# Altium schematic sheet MCU.SchDoc
size A3; DocumentNumber: 1; SheetNumber: 16; SheetTotal: 17
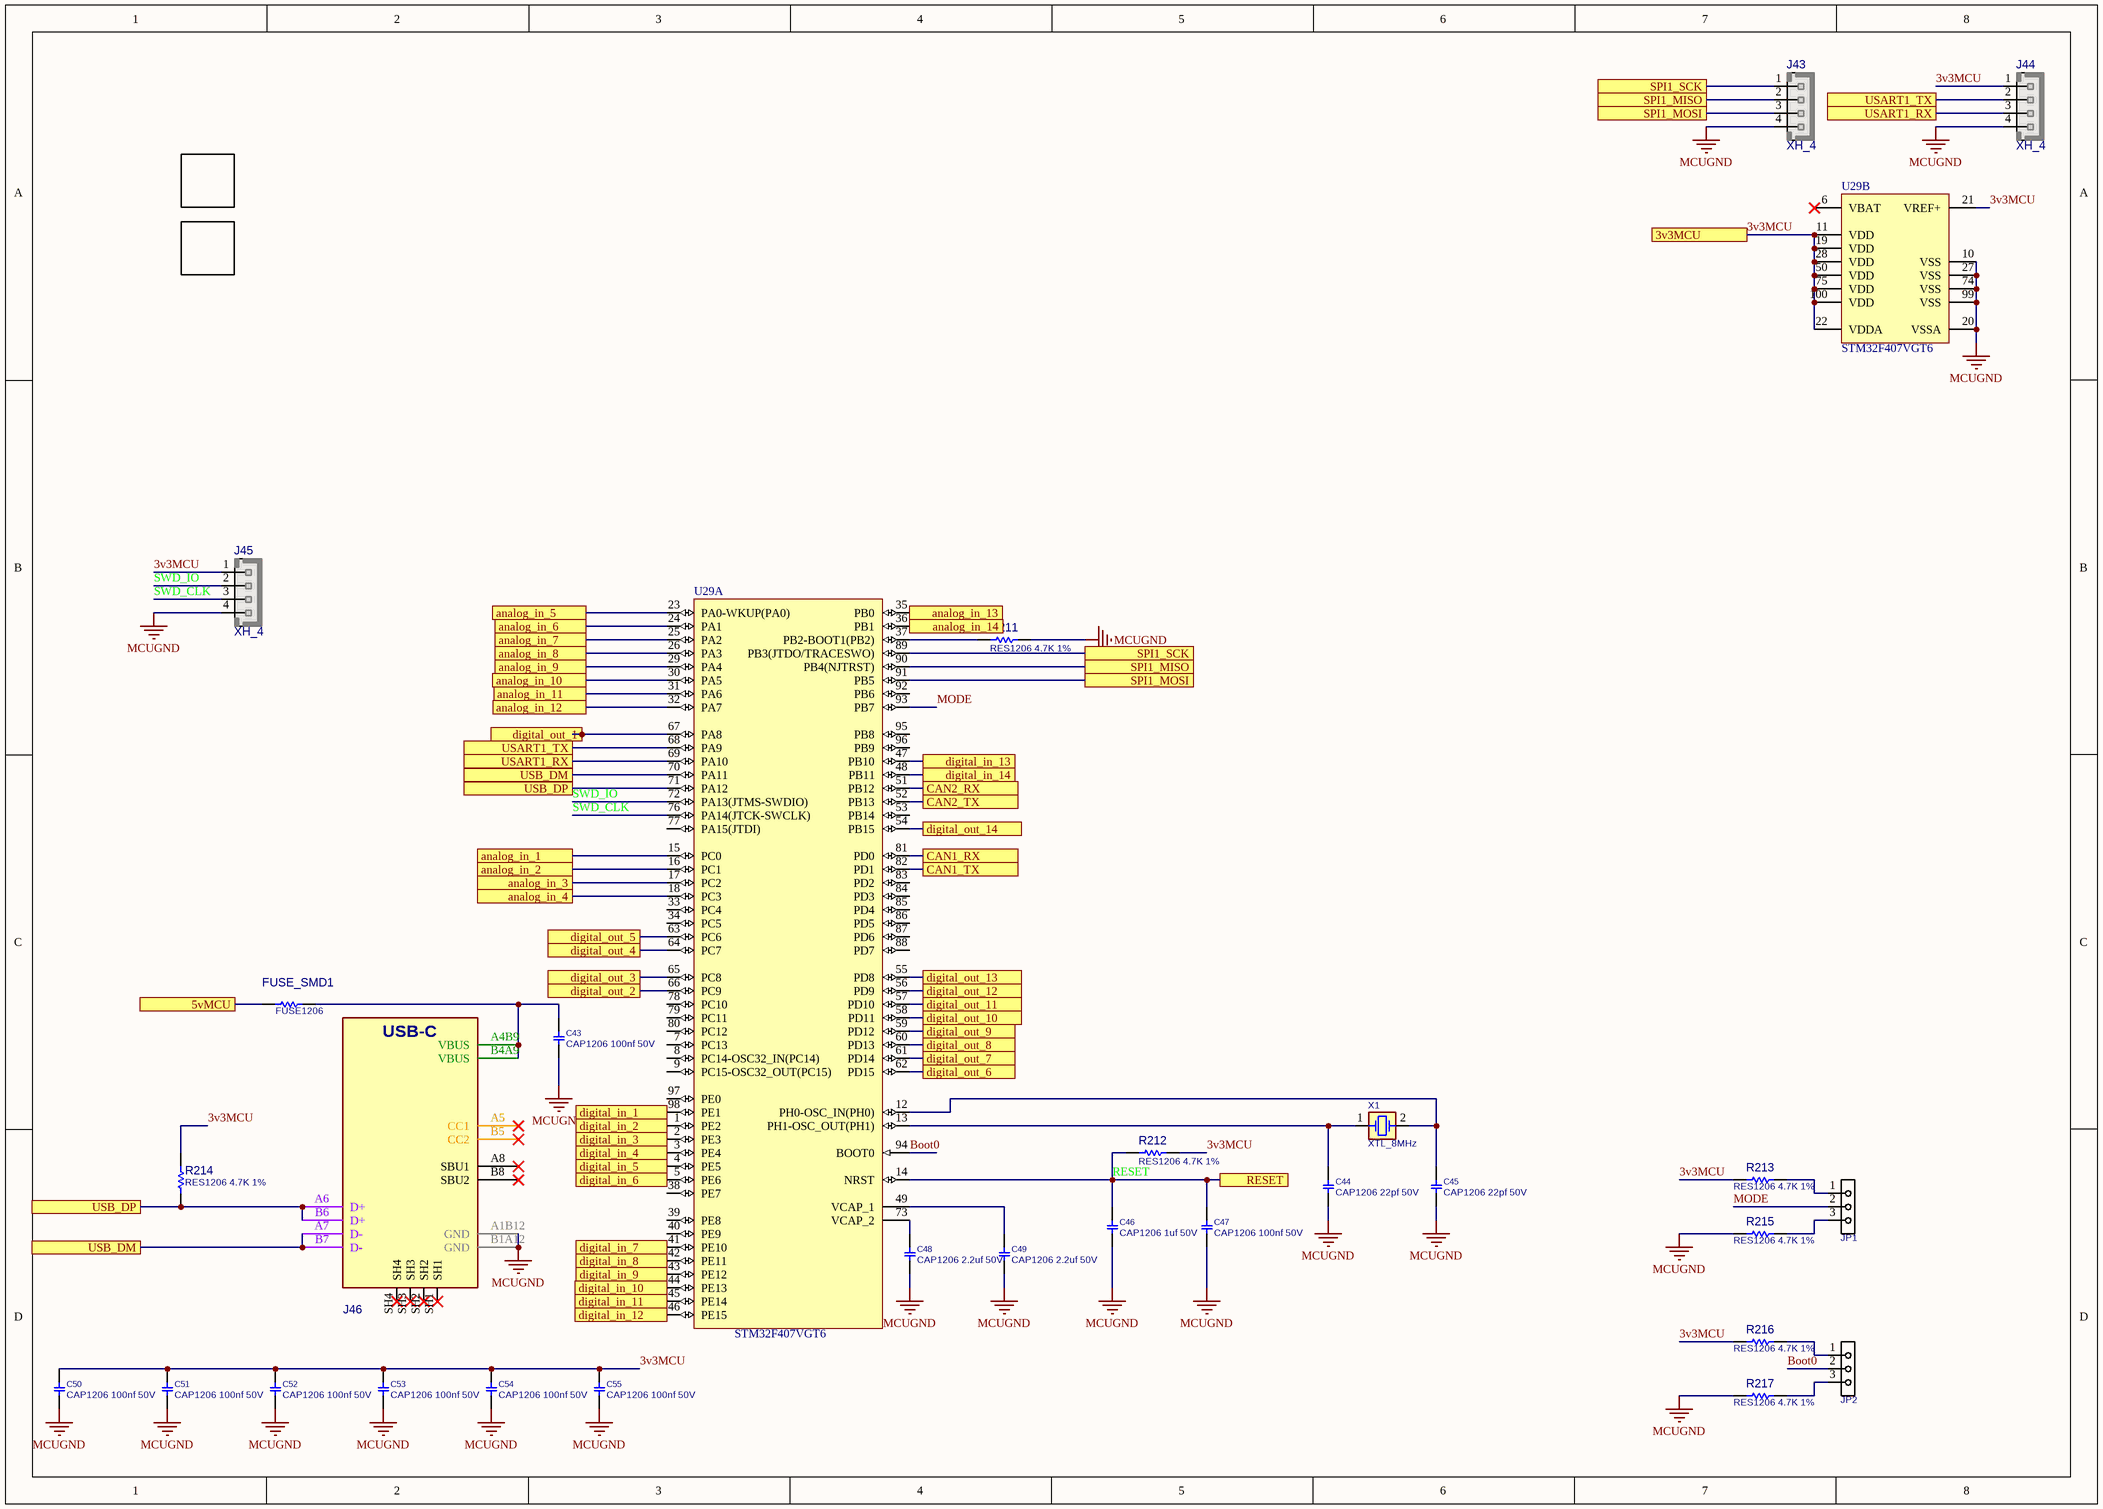
[diagram p0: MCU.SchDoc]

## Parts
C43  CAP1206 100nf 50V  [C1206]
C44  CAP1206 22pf 50V  [C1206]
C45  CAP1206 22pf 50V  [C1206]
C46  CAP1206 1uf 50V  [C1206]
C47  CAP1206 100nf 50V  [C1206]
C48  CAP1206 2.2uf 50V  [C1206]
C49  CAP1206 2.2uf 50V  [C1206]
C50  CAP1206 100nf 50V  [C1206]
C51  CAP1206 100nf 50V  [C1206]
C52  CAP1206 100nf 50V  [C1206]
C53  CAP1206 100nf 50V  [C1206]
C54  CAP1206 100nf 50V  [C1206]
C55  CAP1206 100nf 50V  [C1206]
FUSE_SMD1  FUSE1206  [R1206]
J43  XH_4  [XH_4]
J44  XH_4  [XH_4]
J45  XH_4  [XH_4]
J46  DX07S016JA1  [USBC_SMD_16_DX07S016JA1]  (value not drawn)
JP1  JMPHDR3PIN  [JPH_3]  (value not drawn)
JP2  JMPHDR3PIN  [JPH_3]  (value not drawn)
R211  RES1206 4.7K 1%  [R1206]
R212  RES1206 4.7K 1%  [R1206]
R213  RES1206 4.7K 1%  [R1206]
R214  RES1206 4.7K 1%  [R1206]
R215  RES1206 4.7K 1%  [R1206]
R216  RES1206 4.7K 1%  [R1206]
R217  RES1206 4.7K 1%  [R1206]
RAMON1  WWW.RAMONIC.COM  [PCBComponent_1]  (value not drawn)
RAMON2  WWW.RAMONIC.COM  [PCBComponent_1]  (value not drawn)
U29  STM32F407VGT6  [STM-LQFP100_N]  (parts A,B of 2)
X1  XTL_8MHz  [XTL_2_11X5]

## Ports
3v3MCU, 5vMCU, analog_in_1, analog_in_2, analog_in_3, analog_in_4, analog_in_5, analog_in_6, analog_in_7, analog_in_8, analog_in_9, analog_in_10, analog_in_11, analog_in_12, analog_in_13, analog_in_14, CAN1_RX, CAN1_TX, CAN2_RX, CAN2_TX, digital_in_1, digital_in_2, digital_in_3, digital_in_4, digital_in_5, digital_in_6, digital_in_7, digital_in_8, digital_in_9, digital_in_10, digital_in_11, digital_in_12, digital_in_13, digital_in_14, digital_out_1, digital_out_2, digital_out_3, digital_out_4, digital_out_5, digital_out_6, digital_out_7, digital_out_8, digital_out_9, digital_out_10, digital_out_11, digital_out_12, digital_out_13, digital_out_14, RESET, SPI1_MISO, SPI1_MOSI, SPI1_SCK, USART1_RX, USART1_TX, USB_DM, USB_DP

## Nets
MCUGND: C43.1 C44.1 C45.1 C46.1 C47.1 C48.1 C49.1 C50.1 C51.1 C52.1 C53.1 C54.1 C55.1 J43.4 J44.4 J45.4 J46.A1B12(GND) J46.B1A12(GND) R211.2 R215.2 R217.2 U29.10(VSS) U29.20(VSSA) U29.27(VSS) U29.74(VSS) U29.99(VSS)
3v3MCU: C50.2 C51.2 C52.2 C53.2 C54.2 C55.2 J44.1 J45.1 R212.2 R213.2 R214.1 R216.2 U29.11(VDD) U29.19(VDD) U29.21(VREF+) U29.22(VDDA) U29.28(VDD) U29.50(VDD) U29.75(VDD) U29.100(VDD) ; port 3v3MCU
5vMCU: FUSE_SMD1.1 ; port 5vMCU
analog_in_1: U29.15(PC0) ; port analog_in_1
analog_in_2: U29.16(PC1) ; port analog_in_2
analog_in_3: U29.17(PC2) ; port analog_in_3
analog_in_4: U29.18(PC3) ; port analog_in_4
analog_in_5: U29.23(PA0-WKUP(PA0)) ; port analog_in_5
analog_in_6: U29.24(PA1) ; port analog_in_6
analog_in_7: U29.25(PA2) ; port analog_in_7
analog_in_8: U29.26(PA3) ; port analog_in_8
analog_in_9: U29.29(PA4) ; port analog_in_9
analog_in_10: U29.30(PA5) ; port analog_in_10
analog_in_11: U29.31(PA6) ; port analog_in_11
analog_in_12: U29.32(PA7) ; port analog_in_12
analog_in_13: U29.35(PB0) ; port analog_in_13
analog_in_14: U29.36(PB1) ; port analog_in_14
Boot0: JP2.2 U29.94(BOOT0)
CAN1_RX: U29.81(PD0) ; port CAN1_RX
CAN1_TX: U29.82(PD1) ; port CAN1_TX
CAN2_RX: U29.51(PB12) ; port CAN2_RX
CAN2_TX: U29.52(PB13) ; port CAN2_TX
digital_in_1: U29.98(PE1) ; port digital_in_1
digital_in_2: U29.1(PE2) ; port digital_in_2
digital_in_3: U29.2(PE3) ; port digital_in_3
digital_in_4: U29.3(PE4) ; port digital_in_4
digital_in_5: U29.4(PE5) ; port digital_in_5
digital_in_6: U29.5(PE6) ; port digital_in_6
digital_in_7: U29.41(PE10) ; port digital_in_7
digital_in_8: U29.42(PE11) ; port digital_in_8
digital_in_9: U29.43(PE12) ; port digital_in_9
digital_in_10: U29.44(PE13) ; port digital_in_10
digital_in_11: U29.45(PE14) ; port digital_in_11
digital_in_12: U29.46(PE15) ; port digital_in_12
digital_in_13: U29.47(PB10) ; port digital_in_13
digital_in_14: U29.48(PB11) ; port digital_in_14
digital_out_1: U29.67(PA8) ; port digital_out_1
digital_out_2: U29.66(PC9) ; port digital_out_2
digital_out_3: U29.65(PC8) ; port digital_out_3
digital_out_4: U29.64(PC7) ; port digital_out_4
digital_out_5: U29.63(PC6) ; port digital_out_5
digital_out_6: U29.62(PD15) ; port digital_out_6
digital_out_7: U29.61(PD14) ; port digital_out_7
digital_out_8: U29.60(PD13) ; port digital_out_8
digital_out_9: U29.59(PD12) ; port digital_out_9
digital_out_10: U29.58(PD11) ; port digital_out_10
digital_out_11: U29.57(PD10) ; port digital_out_11
digital_out_12: U29.56(PD9) ; port digital_out_12
digital_out_13: U29.55(PD8) ; port digital_out_13
digital_out_14: U29.54(PB15) ; port digital_out_14
MODE: JP1.2 U29.93(PB7)
RESET: C46.2 C47.2 R212.1 U29.14(NRST) ; port RESET
SPI1_MISO: J43.2 U29.90(PB4(NJTRST)) ; port SPI1_MISO
SPI1_MOSI: J43.3 U29.91(PB5) ; port SPI1_MOSI
SPI1_SCK: J43.1 U29.89(PB3(JTDO/TRACESWO)) ; port SPI1_SCK
SWD_CLK: J45.3 U29.76(PA14(JTCK-SWCLK))
SWD_IO: J45.2 U29.72(PA13(JTMS-SWDIO))
USART1_RX: J44.3 U29.69(PA10) ; port USART1_RX
USART1_TX: J44.2 U29.68(PA9) ; port USART1_TX
USB_DM: J46.A7(D-) J46.B7(D-) U29.70(PA11) ; port USB_DM
USB_DP: J46.A6(D+) J46.B6(D+) R214.2 U29.71(PA12) ; port USB_DP
NetC43_2: C43.2 FUSE_SMD1.2 J46.A4B9(VBUS) J46.B4A9(VBUS)
NetC44_2: C44.2 U29.13(PH1-OSC_OUT(PH1)) X1.1(OSC1)
NetC45_2: C45.2 U29.12(PH0-OSC_IN(PH0)) X1.2(OSC2)
NetC48_2: C48.2 U29.73(VCAP_2)
NetC49_2: C49.2 U29.49(VCAP_1)
NetJP1_1: JP1.1 R213.1
NetJP1_3: JP1.3 R215.1
NetJP2_1: JP2.1 R216.1
NetJP2_3: JP2.3 R217.1
NetR211_1: R211.1 U29.37(PB2-BOOT1(PB2))

Not connected (* = marked no-connect by the designer): J46 A5(CC1)* A8(SBU1)* B5(CC2)* B8(SBU2)* SH1* SH2* SH3* SH4*; U29 6(VBAT)* 7(PC13) 8(PC14-OSC32_IN(PC14)) 9(PC15-OSC32_OUT(PC15)) 33(PC4) 34(PC5) 38(PE7) 39(PE8) 40(PE9) 53(PB14) 77(PA15(JTDI)) 78(PC10) 79(PC11) 80(PC12) 83(PD2) 84(PD3) 85(PD4) 86(PD5) 87(PD6) 88(PD7) 92(PB6) 95(PB8) 96(PB9) 97(PE0)

## Notes on the sheet
- (in symbol CONN_USBC_SMD_16_DX07S016JA1) USB-C

## Library data of the parts
C43-C55 = CAP_SMD_MLCC_1206: CAP, MLCC; PARAM: -, -%; MANF_P#: MANF_PART#; PARAM2: -V; PRICE: 100= 1$; MANF: -; ASSEMBLY: ASSEMBLY
FUSE_SMD1 = RES_SMD_1206: resetable fuse; PARAM: 1%, 0.25W; DESC: DESCRIPTION; DIST#: MOUSER; MANF_P#: -; MANF: -; ASSEMBLY: ASSEMBLY; PRICE: -; PARAM2: -; VALUE: FUSE1206
J43-J45 = XH_4: PW10-x-M, JST-BxB-XH-A pitch: 2.5mm, 3A/250v; MANF: JST; MANF_P#: B4B-XH-A; PARAM2: 250v; PARAM: 3.0A; VALUE: XH_4
J46 = CONN_USBC_SMD_16_DX07S016JA1: CONN, USB, Type C, USB 2.0, Right-Angle, SMD; MANF: JAE; MANF_P#: DX07S016JA1R1500; PARAM: 5A; Price: 1.5$; Value: DX07S016JA1
JP1 JP2 = JUMPER_HDR_3P: JUMPER, HEADER 3PIN; MANF: MANF; MANF_P#: MANF_P#; VALUE: JMPHDR3PIN
R211-R217 = RES_SMD_1206: RESISTOR, SMD; PARAM: 1%, 0.25W; DESC: DESCRIPTION; DIST#: MOUSER; MANF_P#: -; MANF: -; ASSEMBLY: ASSEMBLY; PRICE: -; PARAM2: -
RAMON1 RAMON2 = RamonLogo
U29 = STM32F407VGT6: ARM Cortex-M4 32-bit MCU+FPU, 210 DMIPS, 1024 kB Flash, 192 kB Internal RAM, 82 I/Os, 100-pin LQFP, -40 to 85 degC, Tray; Manufacturer: STMicroelectronics; D/A Converter: 2x12-bit; FLASH Size (Prog) (kB): 1024; I/Os (High Current): 82; Internal RAM Size (kB): 192; Operating Frequency(F) (Processor speed) (MHz): 168; Supply Voltage(Vcc) max (V): 3.6; Supply Voltage(Vcc) min (V): 1.8; DatasheetVersion: Rev. 4; PackageVersion: Rev. 1, 06/2013; PackageReference: LQFP100; PackageDescription: 100-Pin Low Profile Quad Flat Package, 14 x 14 mm Body, 0.5 mm Pitch; Supplier 1: Digi-Key; Supplier Part Number 1: 497-11605-ND; Supplier 2: Farnell; Supplier Part Number 2: 2064368; Supplier 3: Newark; Supplier Part Number 3: 73T2333; Supplier 4: Mouser; Supplier Part Number 4: 511-STM32F407VGT6; Core: ARM Cortex-M4; Packing: Tray; Mounting Technology: Surface Mount; PartNumber: STM32F407VGT6; ComponentLink1Description: Manufacturer URL; ComponentLink1URL: http://www.st.com/web/en/home.html; ComponentLink2Description: Datasheet; ComponentLink2URL: http://www.st.com/st-web-ui/static/active/en/resource/technical/document/datasheet/DM00037051.pdf; ComponentLink3Description: Package Specification; ComponentLink3URL: http://www.st.com/st-web-ui/static/active/en/resource/technical/document/data_brief/DM00071938.pdf
X1 = XTL_2_HC49_8MHz_SMD: Crystal MOST POPULAR ABL HC49 PACKAGE; MANF: ABRACON; MANF_P#: ABLS-8.000MHZ-B4-T; PARAM: 8MHz, 18pF, 30PPM, -20~70oC; PRICE: 0.3$; VALUE: XTL_8MHz